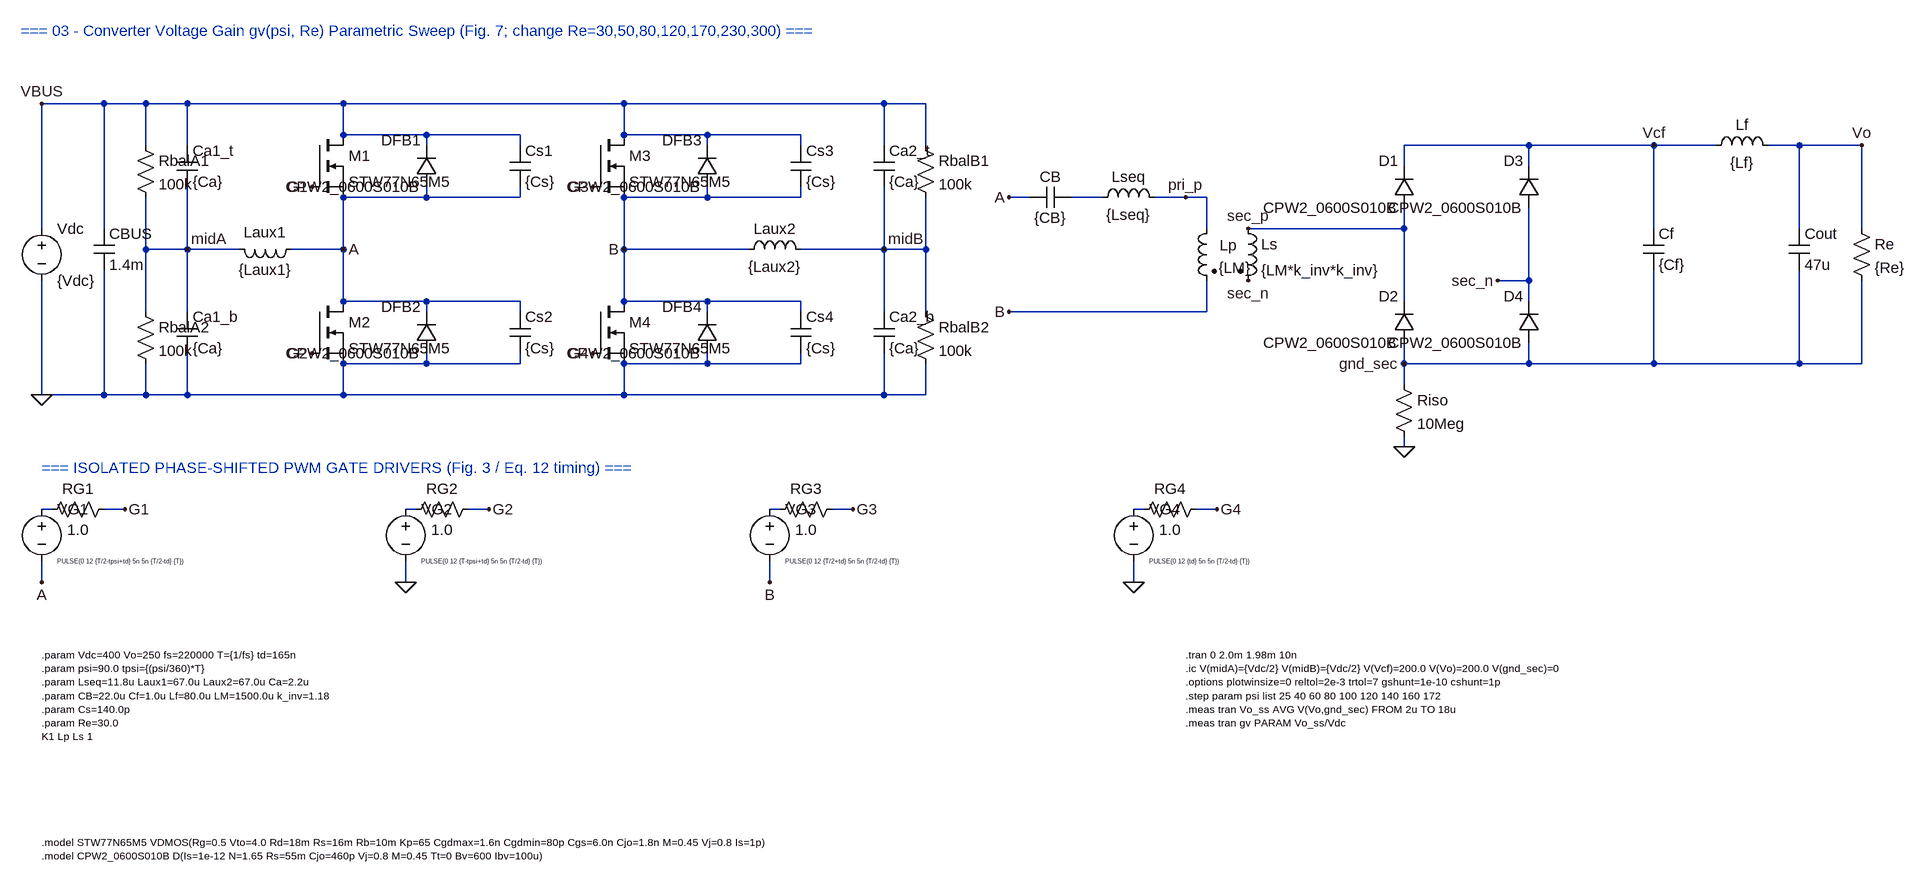
[diagram p0: schematic 03_proposed_gain_sweep_fig7.asc]
03_proposed_gain_sweep_fig7.asc, the LTspice schematic file:
Version 4
SHEET 1 3000 1500
TEXT 64 16 Left 2 ;=== 03 - Converter Voltage Gain gv(psi, Re) Parametric Sweep (Fig. 7; change Re=30,50,80,120,170,230,300) ===
SYMBOL voltage 96 304 R0
SYMATTR InstName Vdc
SYMATTR Value {Vdc}
WIRE 96 320 96 128
WIRE 96 128 304 128
WIRE 96 400 96 576
WIRE 96 576 304 576
FLAG 96 576 0
FLAG 96 128 VBUS
SYMBOL cap 176 320 R0
SYMATTR InstName CBUS
SYMATTR Value 1.4m
SYMATTR SpiceLine Rser=5m
WIRE 192 128 192 320
WIRE 192 384 192 576
SYMBOL cap 304 192 R0
SYMATTR InstName Ca1_t
SYMATTR Value {Ca}
SYMATTR SpiceLine Rser=10m
SYMBOL cap 304 448 R0
SYMATTR InstName Ca1_b
SYMATTR Value {Ca}
SYMATTR SpiceLine Rser=10m
WIRE 304 128 560 128
WIRE 304 576 560 576
WIRE 320 128 320 192
WIRE 320 256 320 448
WIRE 320 512 320 576
FLAG 320 352 midA
SYMBOL res 240 176 R0
SYMATTR InstName RbalA1
SYMATTR Value 100k
WIRE 256 128 256 192
WIRE 256 272 256 352
WIRE 256 352 320 352
SYMBOL res 240 432 R0
SYMATTR InstName RbalA2
SYMATTR Value 100k
WIRE 256 352 256 448
WIRE 256 528 256 576
SYMBOL ind 496 336 R90
WINDOW 0 5 56 VBottom 2
WINDOW 3 32 56 VTop 2
SYMATTR InstName Laux1
SYMATTR Value {Laux1}
SYMATTR SpiceLine Rser=0.1
WIRE 320 352 400 352
WIRE 480 352 560 352
SYMBOL nmos 512 176 R0
SYMATTR InstName M1
SYMATTR Value STW77N65M5
WIRE 560 128 560 176
WIRE 560 272 560 352
FLAG 512 256 G1
SYMBOL diode 704 256 R180
WINDOW 0 24 72 Left 2
WINDOW 3 24 0 Left 2
SYMATTR InstName DFB1
SYMATTR Value CPW2_0600S010B
WIRE 560 176 688 176
WIRE 688 176 688 192
WIRE 688 256 688 272
WIRE 688 272 560 272
SYMBOL cap 816 192 R0
SYMATTR InstName Cs1
SYMATTR Value {Cs}
WIRE 688 176 832 176
WIRE 832 176 832 192
WIRE 832 256 832 272
WIRE 832 272 688 272
SYMBOL nmos 512 432 R0
SYMATTR InstName M2
SYMATTR Value STW77N65M5
WIRE 560 352 560 432
WIRE 560 528 560 576
FLAG 512 512 G2
SYMBOL diode 704 512 R180
WINDOW 0 24 72 Left 2
WINDOW 3 24 0 Left 2
SYMATTR InstName DFB2
SYMATTR Value CPW2_0600S010B
WIRE 560 432 688 432
WIRE 688 432 688 448
WIRE 688 512 688 528
WIRE 688 528 560 528
SYMBOL cap 816 448 R0
SYMATTR InstName Cs2
SYMATTR Value {Cs}
WIRE 688 432 832 432
WIRE 832 432 832 448
WIRE 832 512 832 528
WIRE 832 528 688 528
FLAG 560 352 A
WIRE 560 128 1392 128
WIRE 560 576 1392 576
SYMBOL nmos 944 176 R0
SYMATTR InstName M3
SYMATTR Value STW77N65M5
WIRE 992 128 992 176
WIRE 992 272 992 352
FLAG 944 256 G3
SYMBOL diode 1136 256 R180
WINDOW 0 24 72 Left 2
WINDOW 3 24 0 Left 2
SYMATTR InstName DFB3
SYMATTR Value CPW2_0600S010B
WIRE 992 176 1120 176
WIRE 1120 176 1120 192
WIRE 1120 256 1120 272
WIRE 1120 272 992 272
SYMBOL cap 1248 192 R0
SYMATTR InstName Cs3
SYMATTR Value {Cs}
WIRE 1120 176 1264 176
WIRE 1264 176 1264 192
WIRE 1264 256 1264 272
WIRE 1264 272 1120 272
SYMBOL nmos 944 432 R0
SYMATTR InstName M4
SYMATTR Value STW77N65M5
WIRE 992 352 992 432
WIRE 992 528 992 576
FLAG 944 512 G4
SYMBOL diode 1136 512 R180
WINDOW 0 24 72 Left 2
WINDOW 3 24 0 Left 2
SYMATTR InstName DFB4
SYMATTR Value CPW2_0600S010B
WIRE 992 432 1120 432
WIRE 1120 432 1120 448
WIRE 1120 512 1120 528
WIRE 1120 528 992 528
SYMBOL cap 1248 448 R0
SYMATTR InstName Cs4
SYMATTR Value {Cs}
WIRE 1120 432 1264 432
WIRE 1264 432 1264 448
WIRE 1264 512 1264 528
WIRE 1264 528 1120 528
FLAG 992 352 B
SYMBOL ind 1168 368 R270
WINDOW 0 32 56 VTop 2
WINDOW 3 5 56 VBottom 2
SYMATTR InstName Laux2
SYMATTR Value {Laux2}
SYMATTR SpiceLine Rser=0.1
WIRE 992 352 1184 352
WIRE 1264 352 1392 352
SYMBOL cap 1376 192 R0
SYMATTR InstName Ca2_t
SYMATTR Value {Ca}
SYMATTR SpiceLine Rser=10m
SYMBOL cap 1376 448 R0
SYMATTR InstName Ca2_b
SYMATTR Value {Ca}
SYMATTR SpiceLine Rser=10m
WIRE 1392 128 1392 192
WIRE 1392 256 1392 448
WIRE 1392 512 1392 576
FLAG 1392 352 midB
SYMBOL res 1440 176 R0
SYMATTR InstName RbalB1
SYMATTR Value 100k
WIRE 1392 128 1456 128
WIRE 1456 128 1456 192
WIRE 1456 272 1456 352
WIRE 1456 352 1392 352
SYMBOL res 1440 432 R0
SYMATTR InstName RbalB2
SYMATTR Value 100k
WIRE 1456 352 1456 448
WIRE 1456 528 1456 576
WIRE 1456 576 1392 576
FLAG 1584 272 A
SYMBOL cap 1680 256 R90
WINDOW 0 0 32 VBottom 2
WINDOW 3 32 32 VTop 2
SYMATTR InstName CB
SYMATTR Value {CB}
SYMATTR SpiceLine Rser=5m
WIRE 1584 272 1616 272
SYMBOL ind 1712 288 R270
WINDOW 0 32 56 VTop 2
WINDOW 3 5 56 VBottom 2
SYMATTR InstName Lseq
SYMATTR Value {Lseq}
SYMATTR SpiceLine Rser=0.05
WIRE 1680 272 1728 272
WIRE 1808 272 1888 272
FLAG 1856 272 pri_p
SYMBOL ind2 1904 304 M0
WINDOW 0 -4 42 Right 2
WINDOW 3 -3 76 Right 2
SYMATTR InstName Lp
SYMATTR Value {LM}
SYMATTR SpiceLine Rser=1m
WIRE 1888 272 1888 320
WIRE 1888 400 1888 448
WIRE 1888 448 1584 448
FLAG 1584 448 B
SYMBOL ind2 1936 304 R0
SYMATTR InstName Ls
SYMATTR Value {LM*k_inv*k_inv}
SYMATTR SpiceLine Rser=20m
FLAG 1952 320 sec_p
FLAG 1952 400 sec_n
SYMBOL diode 2208 288 R180
WINDOW 0 24 72 Left 2
WINDOW 3 24 0 Left 2
SYMATTR InstName D1
SYMATTR Value CPW2_0600S010B
SYMBOL diode 2208 496 R180
WINDOW 0 24 72 Left 2
WINDOW 3 24 0 Left 2
SYMATTR InstName D2
SYMATTR Value CPW2_0600S010B
SYMBOL diode 2400 288 R180
WINDOW 0 24 72 Left 2
WINDOW 3 24 0 Left 2
SYMATTR InstName D3
SYMATTR Value CPW2_0600S010B
SYMBOL diode 2400 496 R180
WINDOW 0 24 72 Left 2
WINDOW 3 24 0 Left 2
SYMATTR InstName D4
SYMATTR Value CPW2_0600S010B
WIRE 2192 192 2192 224
WIRE 2192 288 2192 432
WIRE 2192 496 2192 528
WIRE 2384 192 2384 224
WIRE 2384 288 2384 432
WIRE 2384 496 2384 528
WIRE 1952 320 2192 320
FLAG 2336 400 sec_n
WIRE 2336 400 2384 400
WIRE 2192 192 2576 192
WIRE 2192 528 2896 528
FLAG 2576 192 Vcf
FLAG 2192 528 gnd_sec
SYMBOL res 2176 544 R0
SYMATTR InstName Riso
SYMATTR Value 10Meg
WIRE 2192 528 2192 560
WIRE 2192 640 2192 656
FLAG 2192 656 0
SYMBOL cap 2560 320 R0
SYMATTR InstName Cf
SYMATTR Value {Cf}
SYMATTR SpiceLine Rser=20m
WIRE 2576 192 2576 320
WIRE 2576 384 2576 528
SYMBOL ind 2656 208 R270
WINDOW 0 32 56 VTop 2
WINDOW 3 5 56 VBottom 2
SYMATTR InstName Lf
SYMATTR Value {Lf}
SYMATTR SpiceLine Rser=0.05
WIRE 2576 192 2672 192
WIRE 2752 192 2896 192
FLAG 2896 192 Vo
SYMBOL cap 2784 320 R0
SYMATTR InstName Cout
SYMATTR Value 47u
SYMATTR SpiceLine Rser=20m
WIRE 2800 192 2800 320
WIRE 2800 384 2800 528
SYMBOL res 2880 304 R0
SYMATTR InstName Re
SYMATTR Value {Re}
WIRE 2896 192 2896 320
WIRE 2896 400 2896 528
TEXT 96 688 Left 2 ;=== ISOLATED PHASE-SHIFTED PWM GATE DRIVERS (Fig. 3 / Eq. 12 timing) ===
SYMBOL voltage 96 736 R0
WINDOW 0 24 16 Left 2
WINDOW 3 24 96 Left 0
SYMATTR InstName VG1
SYMATTR Value PULSE(0 12 {T/2-tpsi+td} 5n 5n {T/2-td} {T})
SYMBOL res 208 736 R90
WINDOW 0 0 56 VBottom 2
WINDOW 3 32 56 VTop 2
SYMATTR InstName RG1
SYMATTR Value 1.0
WIRE 96 752 112 752
WIRE 192 752 224 752
FLAG 224 752 G1
WIRE 96 832 96 864
FLAG 96 864 A
SYMBOL voltage 656 736 R0
WINDOW 0 24 16 Left 2
WINDOW 3 24 96 Left 0
SYMATTR InstName VG2
SYMATTR Value PULSE(0 12 {T-tpsi+td} 5n 5n {T/2-td} {T})
SYMBOL res 768 736 R90
WINDOW 0 0 56 VBottom 2
WINDOW 3 32 56 VTop 2
SYMATTR InstName RG2
SYMATTR Value 1.0
WIRE 656 752 672 752
WIRE 752 752 784 752
FLAG 784 752 G2
WIRE 656 832 656 864
FLAG 656 864 0
SYMBOL voltage 1216 736 R0
WINDOW 0 24 16 Left 2
WINDOW 3 24 96 Left 0
SYMATTR InstName VG3
SYMATTR Value PULSE(0 12 {T/2+td} 5n 5n {T/2-td} {T})
SYMBOL res 1328 736 R90
WINDOW 0 0 56 VBottom 2
WINDOW 3 32 56 VTop 2
SYMATTR InstName RG3
SYMATTR Value 1.0
WIRE 1216 752 1232 752
WIRE 1312 752 1344 752
FLAG 1344 752 G3
WIRE 1216 832 1216 864
FLAG 1216 864 B
SYMBOL voltage 1776 736 R0
WINDOW 0 24 16 Left 2
WINDOW 3 24 96 Left 0
SYMATTR InstName VG4
SYMATTR Value PULSE(0 12 {td} 5n 5n {T/2-td} {T})
SYMBOL res 1888 736 R90
WINDOW 0 0 56 VBottom 2
WINDOW 3 32 56 VTop 2
SYMATTR InstName RG4
SYMATTR Value 1.0
WIRE 1776 752 1792 752
WIRE 1872 752 1904 752
FLAG 1904 752 G4
WIRE 1776 832 1776 864
FLAG 1776 864 0
TEXT 96 976 Left 1 !.param Vdc=400 Vo=250 fs=220000 T={1/fs} td=165n\n.param psi=90.0 tpsi={(psi/360)*T}\n.param Lseq=11.8u Laux1=67.0u Laux2=67.0u Ca=2.2u\n.param CB=22.0u Cf=1.0u Lf=80.0u LM=1500.0u k_inv=1.18\n.param Cs=140.0p\n.param Re=30.0\nK1 Lp Ls 1
TEXT 96 1264 Left 1 !.model STW77N65M5 VDMOS(Rg=0.5 Vto=4.0 Rd=18m Rs=16m Rb=10m Kp=65 Cgdmax=1.6n Cgdmin=80p Cgs=6.0n Cjo=1.8n M=0.45 Vj=0.8 Is=1p)\n.model CPW2_0600S010B D(Is=1e-12 N=1.65 Rs=55m Cjo=460p Vj=0.8 M=0.45 Tt=0 Bv=600 Ibv=100u)
TEXT 1856 976 Left 1 !.tran 0 2.0m 1.98m 10n\n.ic V(midA)={Vdc/2} V(midB)={Vdc/2} V(Vcf)=200.0 V(Vo)=200.0 V(gnd_sec)=0\n.options plotwinsize=0 reltol=2e-3 trtol=7 gshunt=1e-10 cshunt=1p\n.step param psi list 25 40 60 80 100 120 140 160 172\n.meas tran Vo_ss AVG V(Vo,gnd_sec) FROM 2u TO 18u\n.meas tran gv PARAM Vo_ss/Vdc

The netlist it stands for:
* 03_proposed_gain_sweep_fig7.asc
Vdc VBUS 0 {Vdc}
CBUS VBUS 0 1.4m Rser=5m
Ca1_t VBUS midA {Ca} Rser=10m
Ca1_b midA 0 {Ca} Rser=10m
RbalA1 VBUS midA 100k
RbalA2 midA 0 100k
Laux1 A midA {Laux1} Rser=0.1
M1 VBUS G1 A A STW77N65M5
DFB1 A VBUS CPW2_0600S010B
Cs1 VBUS A {Cs}
M2 A G2 0 0 STW77N65M5
DFB2 0 A CPW2_0600S010B
Cs2 A 0 {Cs}
M3 VBUS G3 B B STW77N65M5
DFB3 B VBUS CPW2_0600S010B
Cs3 VBUS B {Cs}
M4 B G4 0 0 STW77N65M5
DFB4 0 B CPW2_0600S010B
Cs4 B 0 {Cs}
Laux2 B midB {Laux2} Rser=0.1
Ca2_t VBUS midB {Ca} Rser=10m
Ca2_b midB 0 {Ca} Rser=10m
RbalB1 VBUS midB 100k
RbalB2 midB 0 100k
CB N001 A {CB} Rser=5m
Lseq N001 pri_p {Lseq} Rser=0.05
Lp pri_p B {LM} Rser=1m
Ls sec_p sec_n {LM*k_inv*k_inv} Rser=20m
D1 sec_p Vcf CPW2_0600S010B
D2 gnd_sec sec_p CPW2_0600S010B
D3 sec_n Vcf CPW2_0600S010B
D4 gnd_sec sec_n CPW2_0600S010B
Riso gnd_sec 0 10Meg
Cf Vcf gnd_sec {Cf} Rser=20m
Lf Vcf Vo {Lf} Rser=0.05
Cout Vo gnd_sec 47u Rser=20m
Re Vo gnd_sec {Re}
VG1 N002 A PULSE(0 12 {T/2-tpsi+td} 5n 5n {T/2-td} {T})
RG1 G1 N002 1.0
VG2 N003 0 PULSE(0 12 {T-tpsi+td} 5n 5n {T/2-td} {T})
RG2 G2 N003 1.0
VG3 N004 B PULSE(0 12 {T/2+td} 5n 5n {T/2-td} {T})
RG3 G3 N004 1.0
VG4 N005 0 PULSE(0 12 {td} 5n 5n {T/2-td} {T})
RG4 G4 N005 1.0
.model D D
.lib standard.dio
.model NMOS NMOS
.model PMOS PMOS
.lib standard.mos
* === 03 - Converter Voltage Gain gv(psi, Re) Parametric Sweep (Fig. 7; change Re=30,50,80,120,170,230,300) ===
* === ISOLATED PHASE-SHIFTED PWM GATE DRIVERS (Fig. 3 / Eq. 12 timing) ===
.param Vdc=400 Vo=250 fs=220000 T={1/fs} td=165n
.param psi=90.0 tpsi={(psi/360)*T}
.param Lseq=11.8u Laux1=67.0u Laux2=67.0u Ca=2.2u
.param CB=22.0u Cf=1.0u Lf=80.0u LM=1500.0u k_inv=1.18
.param Cs=140.0p
.param Re=30.0
K1 Lp Ls 1
.model STW77N65M5 VDMOS(Rg=0.5 Vto=4.0 Rd=18m Rs=16m Rb=10m Kp=65 Cgdmax=1.6n Cgdmin=80p Cgs=6.0n Cjo=1.8n M=0.45 Vj=0.8 Is=1p)
.model CPW2_0600S010B D(Is=1e-12 N=1.65 Rs=55m Cjo=460p Vj=0.8 M=0.45 Tt=0 Bv=600 Ibv=100u)
.tran 0 2.0m 1.98m 10n
.ic V(midA)={Vdc/2} V(midB)={Vdc/2} V(Vcf)=200.0 V(Vo)=200.0 V(gnd_sec)=0
.options plotwinsize=0 reltol=2e-3 trtol=7 gshunt=1e-10 cshunt=1p
.step param psi list 25 40 60 80 100 120 140 160 172
.meas tran Vo_ss AVG V(Vo,gnd_sec) FROM 2u TO 18u
.meas tran gv PARAM Vo_ss/Vdc
.backanno
.end